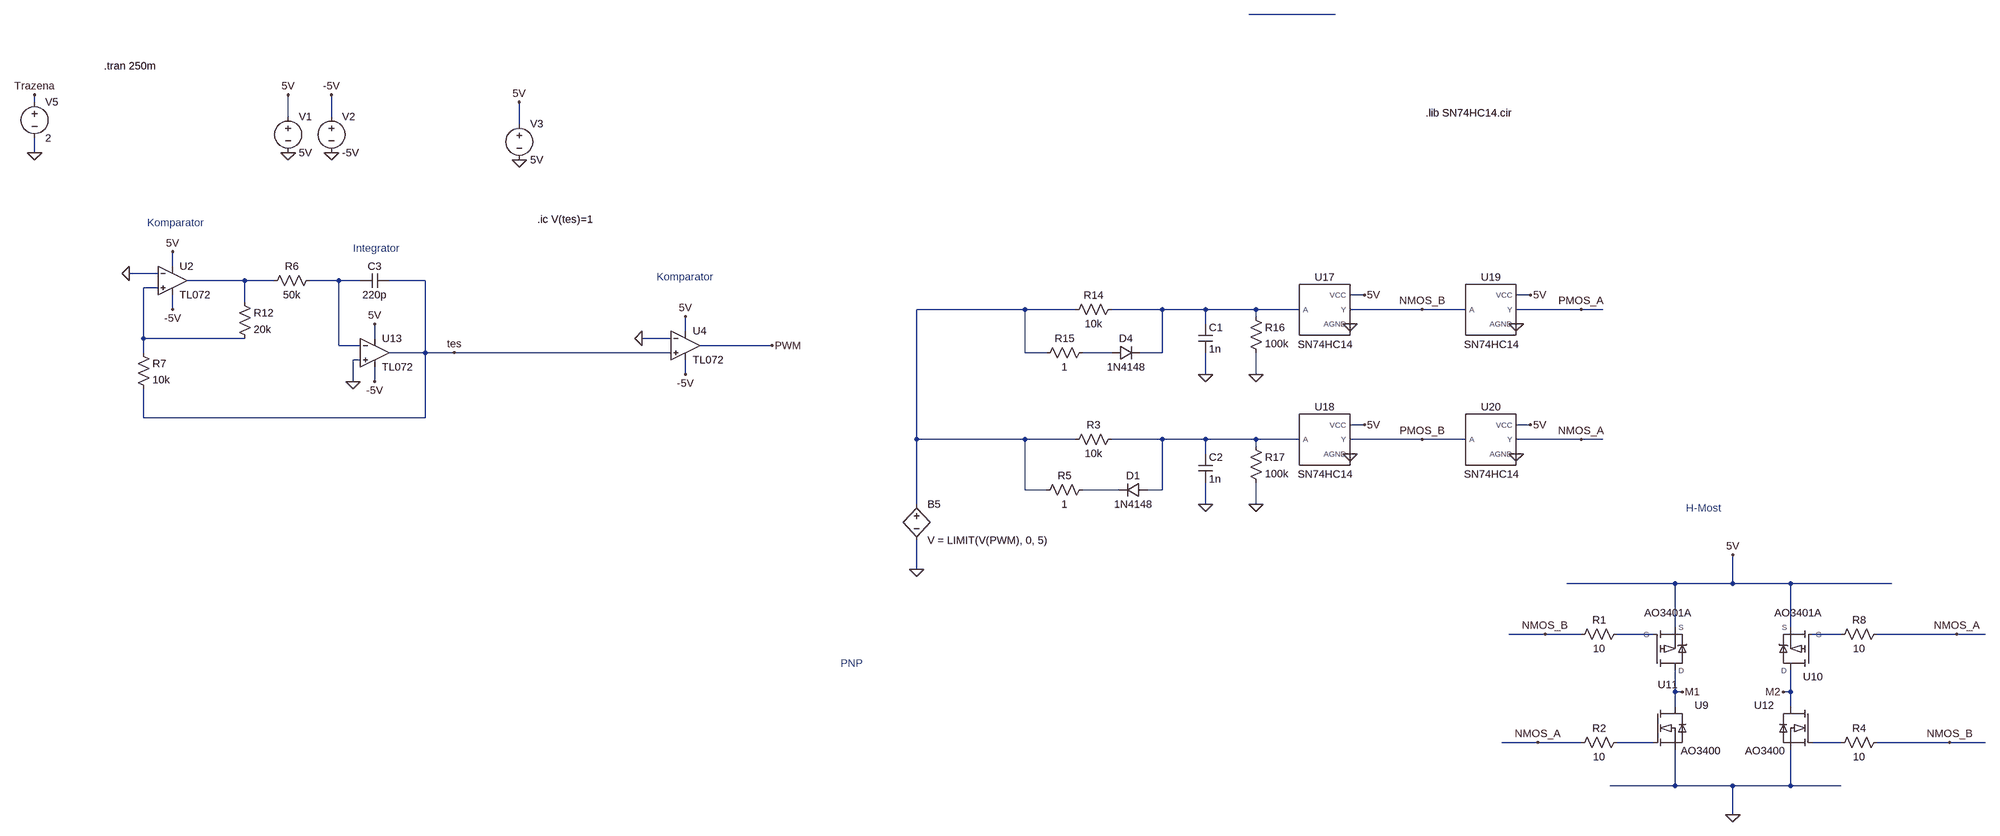
[diagram p0: schematic gate_drivers_4.asc]
gate_drivers_4.asc, the LTspice schematic file:
Version 4
SHEET 1 6380 2180
WIRE 2128 -960 1936 -960
WIRE -1392 -624 -1392 -640
WIRE -272 -592 -272 -640
WIRE -176 -592 -176 -640
WIRE 240 -576 240 -624
WIRE -1392 -512 -1392 -544
WIRE -528 -192 -528 -224
WIRE -560 -176 -624 -176
WIRE -368 -160 -496 -160
WIRE -304 -160 -368 -160
WIRE -160 -160 -224 -160
WIRE -112 -160 -160 -160
WIRE 32 -160 -48 -160
WIRE -560 -144 -592 -144
WIRE 2192 -128 2160 -128
WIRE 2560 -128 2528 -128
WIRE -368 -112 -368 -160
WIRE -528 -96 -528 -128
WIRE 1440 -96 1200 -96
WIRE 1552 -96 1440 -96
WIRE 1744 -96 1632 -96
WIRE 1840 -96 1744 -96
WIRE 1952 -96 1840 -96
WIRE 2048 -96 1952 -96
WIRE 2320 -96 2160 -96
WIRE 2416 -96 2320 -96
WIRE 2672 -96 2528 -96
WIRE 2720 -96 2672 -96
WIRE 1952 -80 1952 -96
WIRE 1840 -64 1840 -96
WIRE 608 -48 608 -80
WIRE -592 -32 -592 -144
WIRE -368 -32 -592 -32
WIRE -80 -32 -80 -64
WIRE 576 -32 512 -32
WIRE -160 -16 -160 -160
WIRE -112 -16 -160 -16
WIRE 880 -16 640 -16
WIRE -592 0 -592 -32
WIRE 32 0 32 -160
WIRE 32 0 -48 0
WIRE 96 0 32 0
WIRE 576 0 96 0
WIRE 1440 0 1440 -96
WIRE 1488 0 1440 0
WIRE 1632 0 1568 0
WIRE 1744 0 1744 -96
WIRE 1744 0 1696 0
WIRE -112 16 -128 16
WIRE 608 48 608 16
WIRE 1840 48 1840 0
WIRE 1952 48 1952 0
WIRE -128 64 -128 16
WIRE -80 64 -80 32
WIRE -592 144 -592 80
WIRE 32 144 32 0
WIRE 32 144 -592 144
WIRE 2192 160 2160 160
WIRE 2560 160 2528 160
WIRE 1200 192 1200 -96
WIRE 1440 192 1200 192
WIRE 1552 192 1440 192
WIRE 1744 192 1632 192
WIRE 1840 192 1744 192
WIRE 1952 192 1840 192
WIRE 2048 192 1952 192
WIRE 2320 192 2160 192
WIRE 2416 192 2320 192
WIRE 2672 192 2528 192
WIRE 2720 192 2672 192
WIRE 1952 208 1952 192
WIRE 1840 224 1840 192
WIRE 1440 304 1440 192
WIRE 1488 304 1440 304
WIRE 1648 304 1568 304
WIRE 1744 304 1744 192
WIRE 1744 304 1712 304
WIRE 1200 336 1200 192
WIRE 1840 336 1840 288
WIRE 1952 336 1952 288
WIRE 1200 480 1200 416
WIRE 2880 512 2640 512
WIRE 3008 512 3008 448
WIRE 3008 512 2880 512
WIRE 3136 512 3008 512
WIRE 3360 512 3136 512
WIRE 2880 608 2880 512
WIRE 3136 608 3136 512
WIRE 2592 624 2512 624
WIRE 2672 624 2592 624
WIRE 2832 624 2752 624
WIRE 3248 624 3184 624
WIRE 3504 624 3328 624
WIRE 3568 624 3504 624
WIRE 2880 752 2880 704
WIRE 2896 752 2880 752
WIRE 3136 752 3136 704
WIRE 3136 752 3120 752
WIRE 2880 784 2880 752
WIRE 3136 784 3136 752
WIRE 2576 864 2496 864
WIRE 2672 864 2576 864
WIRE 2832 864 2752 864
WIRE 3248 864 3184 864
WIRE 3488 864 3328 864
WIRE 3568 864 3488 864
WIRE 2880 960 2880 880
WIRE 2880 960 2736 960
WIRE 3008 960 2880 960
WIRE 3136 960 3136 880
WIRE 3136 960 3008 960
WIRE 3248 960 3136 960
WIRE 3008 1024 3008 960
FLAG -272 -512 0
FLAG -272 -640 5V
FLAG -176 -512 0
FLAG -176 -640 -5V
FLAG 880 -16 PWM
FLAG -1392 -512 0
FLAG -1392 -640 Trazena
FLAG 2896 752 M1
FLAG 3120 752 M2
FLAG -128 64 0
FLAG -624 -176 0
FLAG -528 -96 -5V
FLAG -528 -224 5V
FLAG -80 -64 5V
FLAG -80 64 -5V
FLAG 96 0 tes
FLAG 608 -80 5V
FLAG 608 48 -5V
FLAG 3008 448 5V
FLAG 2192 -128 5V
FLAG 2160 -64 0
FLAG 2192 160 5V
FLAG 2160 224 0
FLAG 2560 -128 5V
FLAG 2528 -64 0
FLAG 2560 160 5V
FLAG 2528 224 0
FLAG 1952 48 0
FLAG 1952 336 0
FLAG 1840 48 0
FLAG 1840 336 0
FLAG 2672 192 NMOS_A
FLAG 2672 -96 PMOS_A
FLAG 2320 -96 NMOS_B
FLAG 2320 192 PMOS_B
FLAG 2576 864 NMOS_A
FLAG 3488 864 NMOS_B
FLAG 1200 480 0
FLAG 3008 1024 0
FLAG 240 -496 0
FLAG 240 -624 5V
FLAG 3504 624 NMOS_A
FLAG 2592 624 NMOS_B
FLAG 512 -32 0
SYMBOL voltage -272 -608 R0
WINDOW 123 0 0 Left 0
WINDOW 39 0 0 Left 0
SYMATTR InstName V1
SYMATTR Value 5V
SYMBOL voltage -176 -608 R0
WINDOW 123 0 0 Left 0
WINDOW 39 0 0 Left 0
SYMATTR InstName V2
SYMATTR Value -5V
SYMBOL voltage -1392 -640 R0
WINDOW 123 0 0 Left 0
WINDOW 39 0 0 Left 0
SYMATTR InstName V5
SYMATTR Value 2
SYMBOL AO3400 2912 848 R0
SYMATTR InstName U9
SYMBOL AO3401A 3104 672 R180
WINDOW 0 -82 -31 Bottom 2
SYMATTR InstName U10
SYMBOL AO3401A 2912 672 M180
SYMATTR InstName U11
SYMBOL AO3400 3104 848 M0
SYMATTR InstName U12
SYMBOL res -208 -176 R90
WINDOW 0 0 56 VBottom 2
WINDOW 3 32 56 VTop 2
SYMATTR InstName R6
SYMATTR Value 50k
SYMBOL cap -48 -176 R90
WINDOW 0 0 32 VBottom 2
WINDOW 3 32 32 VTop 2
SYMATTR InstName C3
SYMATTR Value 220p
SYMBOL res -608 -16 R0
SYMATTR InstName R7
SYMATTR Value 10k
SYMBOL res -384 -128 R0
SYMATTR InstName R12
SYMATTR Value 20k
SYMBOL ZZZ\\OpAmp\\TL072 -528 -160 R0
SYMATTR InstName U2
SYMBOL ZZZ\\OpAmp\\TL072 -80 0 R0
SYMATTR InstName U13
SYMBOL ZZZ\\OpAmp\\TL072 608 -16 R0
SYMATTR InstName U4
SYMBOL res 1648 176 R90
WINDOW 0 0 56 VBottom 2
WINDOW 3 32 56 VTop 2
SYMATTR InstName R3
SYMATTR Value 10k
SYMBOL diode 1712 288 R90
WINDOW 0 0 32 VBottom 2
WINDOW 3 32 32 VTop 2
SYMATTR InstName D1
SYMATTR Value 1N4148
SYMBOL res 1584 288 R90
WINDOW 0 0 56 VBottom 2
WINDOW 3 32 56 VTop 2
SYMATTR InstName R5
SYMATTR Value 1
SYMBOL res 1648 -112 R90
WINDOW 0 0 56 VBottom 2
WINDOW 3 32 56 VTop 2
SYMATTR InstName R14
SYMATTR Value 10k
SYMBOL diode 1632 16 R270
WINDOW 0 32 32 VTop 2
WINDOW 3 0 32 VBottom 2
SYMATTR InstName D4
SYMATTR Value 1N4148
SYMBOL res 1584 -16 R90
WINDOW 0 0 56 VBottom 2
WINDOW 3 32 56 VTop 2
SYMATTR InstName R15
SYMATTR Value 1
SYMBOL SN74HC14 2096 -112 R0
WINDOW 3 9 78 Top 2
SYMATTR InstName U17
SYMBOL SN74HC14 2096 176 R0
WINDOW 3 9 78 Top 2
SYMATTR InstName U18
SYMBOL SN74HC14 2464 -112 R0
WINDOW 3 9 78 Top 2
SYMATTR InstName U19
SYMBOL SN74HC14 2464 176 R0
WINDOW 3 9 78 Top 2
SYMATTR InstName U20
SYMBOL res 1936 -96 R0
SYMATTR InstName R16
SYMATTR Value 100k
SYMBOL res 1936 192 R0
SYMATTR InstName R17
SYMATTR Value 100k
SYMBOL cap 1824 -64 R0
SYMATTR InstName C1
SYMATTR Value 1n
SYMBOL cap 1824 224 R0
SYMATTR InstName C2
SYMATTR Value 1n
SYMBOL bv 1200 320 R0
SYMATTR InstName B5
SYMATTR Value V = LIMIT(V(PWM), 0, 5)
SYMBOL voltage 240 -592 R0
WINDOW 123 0 0 Left 0
WINDOW 39 0 0 Left 0
SYMATTR InstName V3
SYMATTR Value 5V
SYMBOL res 2768 608 R90
WINDOW 0 0 56 VBottom 2
WINDOW 3 32 56 VTop 2
SYMATTR InstName R1
SYMATTR Value 10
SYMBOL res 2768 848 R90
WINDOW 0 0 56 VBottom 2
WINDOW 3 32 56 VTop 2
SYMATTR InstName R2
SYMATTR Value 10
SYMBOL res 3344 848 R90
WINDOW 0 0 56 VBottom 2
WINDOW 3 32 56 VTop 2
SYMATTR InstName R4
SYMATTR Value 10
SYMBOL res 3344 608 R90
WINDOW 0 0 56 VBottom 2
WINDOW 3 32 56 VTop 2
SYMATTR InstName R8
SYMATTR Value 10
TEXT -680 -704 Left 2 !.tran 250m
TEXT 544 -168 Left 2 ;Komparator
TEXT 1032 688 Left 2 ;PNP
TEXT 2904 344 Left 2 ;H-Most
TEXT 280 -296 Left 2 !.ic V(tes)=1
TEXT -128 -232 Left 2 ;Integrator
TEXT -584 -288 Left 2 ;Komparator
TEXT 2328 -600 Left 2 !.lib SN74HC14.cir

The netlist it stands for:
* gate_drivers_4.asc
V1 5V 0 5V
V2 -5V 0 -5V
V5 Trazena 0 2
XU9 M1 N012 0 AO3400  ; pins 1 4 2
XU10 M2 N011 5V AO3401A  ; pins D G S
XU11 M1 N010 5V AO3401A  ; pins D G S
XU12 M2 N013 0 AO3400  ; pins 1 4 2
R6 N003 N002 50k
C3 tes N003 220p
R7 N004 tes 10k
R12 N002 N004 20k
* U2: TL072 (symbol ZZZ\OpAmp\TL072 not available, pins judged from their places): In+=N004 In-=0 V+=5V V-=-5V OUT=N002
* U13: TL072 (symbol ZZZ\OpAmp\TL072 not available, pins judged from their places): In+=0 In-=N003 V+=5V V-=-5V OUT=tes
* U4: TL072 (symbol ZZZ\OpAmp\TL072 not available, pins judged from their places): In+=tes In-=0 V+=5V V-=-5V OUT=PWM
R3 N008 N005 10k
D1 N008 N009 1N4148
R5 N009 N005 1
R14 N006 N005 10k
D4 N007 N006 1N4148
R15 N007 N005 1
XU17 NMOS_B N006 5V 0 SN74HC14  ; pins Y A VCC AGND
XU18 PMOS_B N008 5V 0 SN74HC14  ; pins Y A VCC AGND
XU19 PMOS_A NMOS_B 5V 0 SN74HC14  ; pins Y A VCC AGND
XU20 NMOS_A PMOS_B 5V 0 SN74HC14  ; pins Y A VCC AGND
R16 N006 0 100k
R17 N008 0 100k
C1 N006 0 1n
C2 N008 0 1n
B5 N005 0 V = LIMIT(V(PWM), 0, 5)
V3 5V 0 5V
R1 N010 NMOS_B 10
R2 N012 NMOS_A 10
R4 NMOS_B N013 10
R8 NMOS_A N011 10
.model D D
.lib standard.dio
.tran 250m
* Komparator
* PNP
* H-Most
.ic V(tes)=1
* Integrator
* Komparator
.lib SN74HC14.cir
.lib AO3400.mod
.lib AO3401A.mod
.lib SN74HC14.cir
.backanno
.end